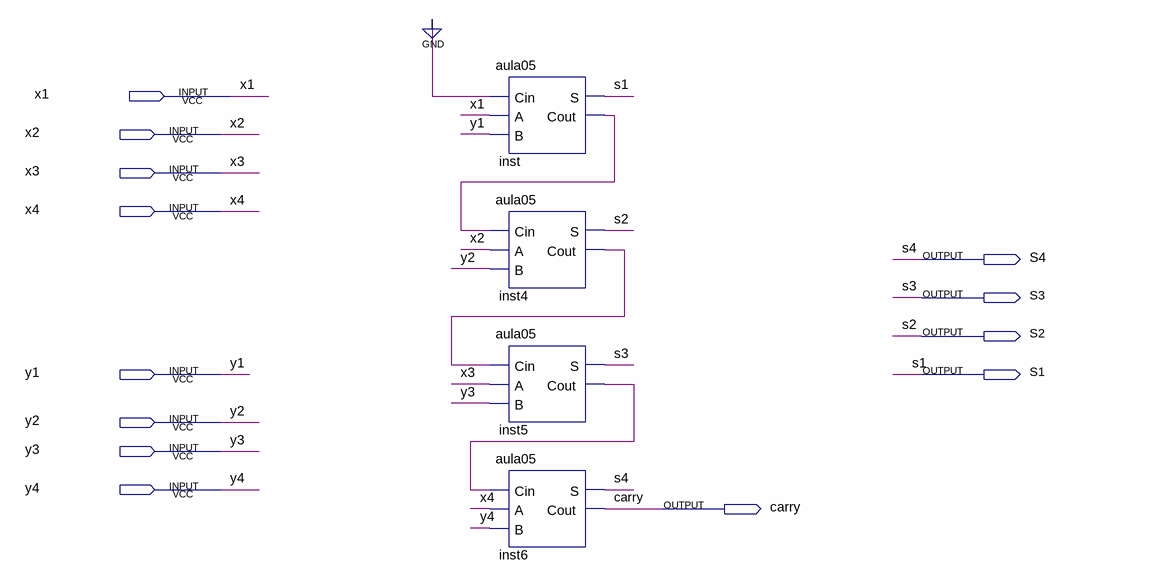
[diagram p0: schematic sheet]
// Quartus schematic somador4.bdf as structural Verilog: 4 symbols, 13 pins
module somador4 (
  input  x1,
  input  x2,
  input  x3,
  input  x4,
  input  y1,
  input  y2,
  input  y3,
  input  y4,
  output S4,
  output S3,
  output S2,
  output S1,
  output carry
);

  wire inst4_cout, inst5_cout, inst_cout;

  aula05 inst (.Cin(1'b0), .A(x1), .B(y1), .S(S1), .Cout(inst_cout));
  aula05 inst4 (.Cin(inst_cout), .A(x2), .B(y2), .S(S2), .Cout(inst4_cout));
  aula05 inst5 (.Cin(inst4_cout), .A(x3), .B(y3), .S(S3), .Cout(inst5_cout));
  aula05 inst6 (.Cin(inst5_cout), .A(x4), .B(y4), .S(S4), .Cout(carry));
endmodule
